# Altium schematic sheet switch_isolation.SchDoc: 3.3V Resistor-Zener Clamp for channel input sense
size A4; DocumentNumber: ADC-SCH-10; SheetNumber: 10; SheetTotal: 20
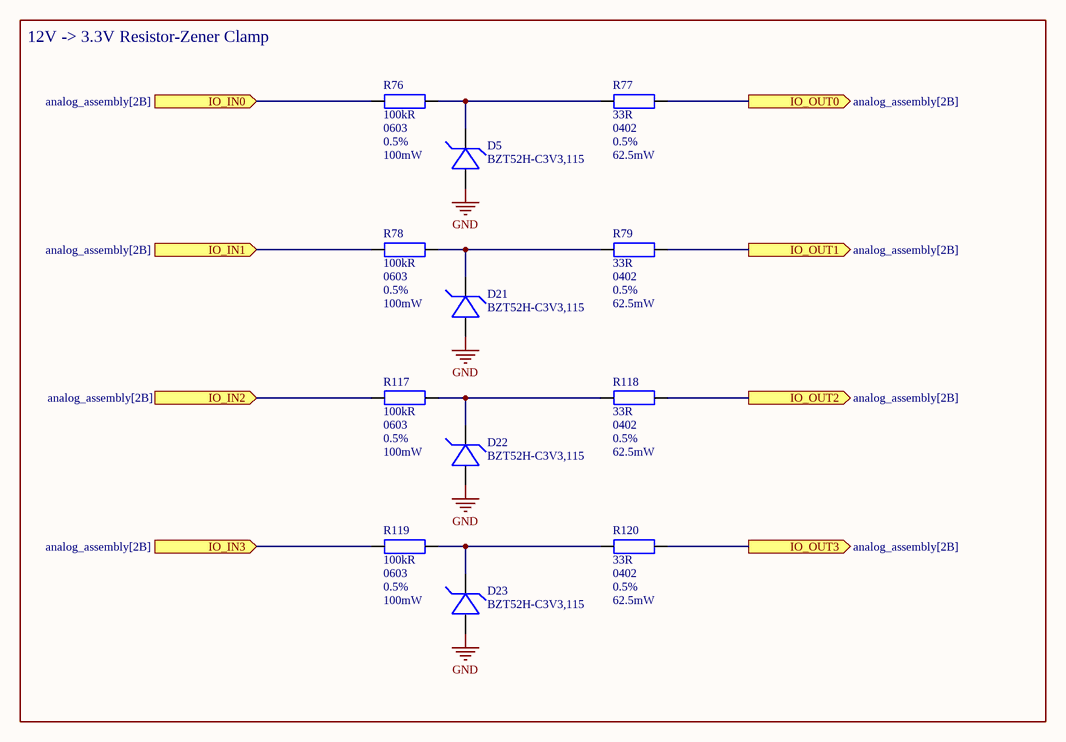
[diagram p0: switch_isolation.SchDoc]

## Parts
D5  BZT52H-C3V3,115  [DIOC_SOD-123F-2]
D21  BZT52H-C3V3,115  [DIOC_SOD-123F-2]
D22  BZT52H-C3V3,115  [DIOC_SOD-123F-2]
D23  BZT52H-C3V3,115  [DIOC_SOD-123F-2]
R76  value 100kR  Package: 0603  Tolerance: 0.5%  Power: 100mW  [RESC_0603]  (hidden comment: AC0603DR-07100KL)
R77  value 33R  Package: 0402  Tolerance: 0.5%  Power: 62.5mW  [RESC_0402]  (hidden comment: RG1005R-330-D-T10)
R78  value 100kR  Package: 0603  Tolerance: 0.5%  Power: 100mW  [RESC_0603]  (hidden comment: AC0603DR-07100KL)
R79  value 33R  Package: 0402  Tolerance: 0.5%  Power: 62.5mW  [RESC_0402]  (hidden comment: RG1005R-330-D-T10)
R117  value 100kR  Package: 0603  Tolerance: 0.5%  Power: 100mW  [RESC_0603]  (hidden comment: AC0603DR-07100KL)
R118  value 33R  Package: 0402  Tolerance: 0.5%  Power: 62.5mW  [RESC_0402]  (hidden comment: RG1005R-330-D-T10)
R119  value 100kR  Package: 0603  Tolerance: 0.5%  Power: 100mW  [RESC_0603]  (hidden comment: AC0603DR-07100KL)
R120  value 33R  Package: 0402  Tolerance: 0.5%  Power: 62.5mW  [RESC_0402]  (hidden comment: RG1005R-330-D-T10)

## Blocks framed on the sheet
12V -> 3.3V Resistor-Zener Clamp: D5 D21-D23 R76-R79 R117-R120

## Ports
IO_IN0 (in, see analog_assembly[2B]), IO_IN1 (in, see analog_assembly[2B]), IO_IN2 (in, see analog_assembly[2B]), IO_IN3 (in, see analog_assembly[2B]), IO_OUT0 (out, see analog_assembly[2B]), IO_OUT1 (out, see analog_assembly[2B]), IO_OUT2 (out, see analog_assembly[2B]), IO_OUT3 (out, see analog_assembly[2B])

## Nets
GND: D5.1 D21.1 D22.1 D23.1
IO_IN0: R76.2 ; port IO_IN0
IO_IN1: R78.2 ; port IO_IN1
IO_IN2: R117.2 ; port IO_IN2
IO_IN3: R119.2 ; port IO_IN3
IO_OUT0: R77.1 ; port IO_OUT0
IO_OUT1: R79.1 ; port IO_OUT1
IO_OUT2: R118.1 ; port IO_OUT2
IO_OUT3: R120.1 ; port IO_OUT3
NetD5_2: D5.2 R76.1 R77.2
NetD21_2: D21.2 R78.1 R79.2
NetD22_2: D22.2 R117.1 R118.2
NetD23_2: D23.2 R119.1 R120.2

## Notes on the sheet
- Drawn by
- Approved by
- Document type
- Date of issue
- Legal owner
- Title
- Circuit diagram
- File
- AGH Marines
- Document no.
- Revision
- Status
- Sheet
- Size
- Lang.
- /
- A4
- EN

## Library data of the parts
D5 D21-D23 = BZT52H-C3V3,115: Zener Diodes ZENER SOD-123 .83W 3.3V; Manufacturer: Nexperia; Package: SOD-123F-2; Breakdown voltage: 3.3V; Supplier 1: Mouser; Supplier Part Number 1: 771-BZT52H-C3V3-T/R
R76 R78 R117 R119 = AC0603DR-07100KL: Thick Film Resistors - SMD 100 kOhms 1/10 W 75 V 0.5 % 0603 100 PPM / C - 55 C / + 155 C AEC-Q200; Manufacturer: YAGEO; Supplier 1: Mouser; Supplier Part Number 1: 603-AC0603DR-07100KL
R77 R79 R118 R120 = RG1005R-330-D-T10: Thin Film Resistors - SMD 1/16W 33 Ohms 0.5% 0402 100ppm; Manufacturer: Susumu; Supplier 1: Mouser; Supplier Part Number 1: 754-RG1005R-330DT10